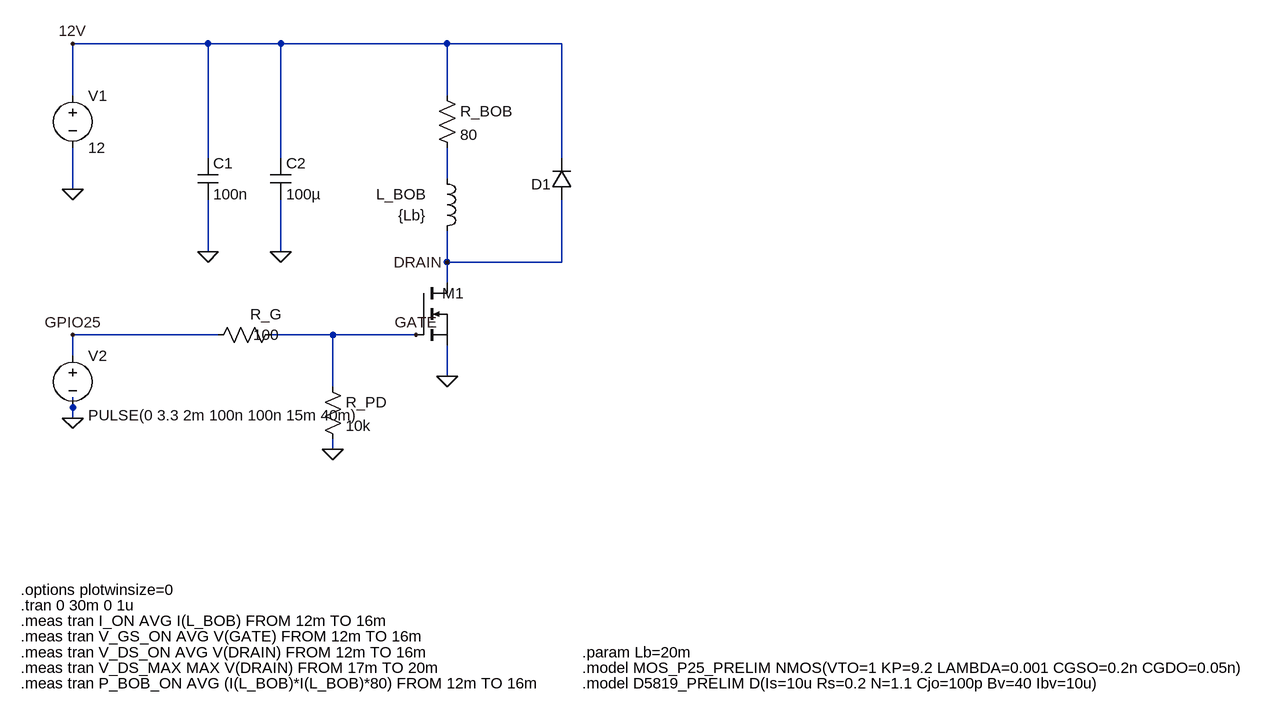
[diagram p0: schematic 01_P25_Pulsos.asc]
01_P25_Pulsos.asc, the LTspice schematic file:
Version 4.1
SHEET 1 1976 1200
WIRE 336 112 128 112
WIRE 448 112 336 112
WIRE 704 112 448 112
WIRE 880 112 704 112
WIRE 128 192 128 112
WIRE 704 192 704 112
WIRE 336 288 336 112
WIRE 448 288 448 112
WIRE 880 288 880 112
WIRE 704 320 704 272
WIRE 128 336 128 272
WIRE 336 432 336 352
WIRE 448 432 448 352
WIRE 704 448 704 400
WIRE 880 448 880 352
WIRE 880 448 704 448
WIRE 704 480 704 448
WIRE 352 560 128 560
WIRE 528 560 432 560
WIRE 656 560 528 560
WIRE 128 592 128 560
WIRE 704 624 704 576
WIRE 528 640 528 560
WIRE 128 672 128 656
WIRE 128 688 128 672
WIRE 528 736 528 720
FLAG 128 112 12V
FLAG 704 448 DRAIN
FLAG 656 560 GATE
FLAG 128 560 GPIO25
FLAG 128 336 0
FLAG 128 688 0
FLAG 336 432 0
FLAG 448 432 0
FLAG 528 736 0
FLAG 704 624 0
SYMBOL voltage 128 176 R0
SYMATTR InstName V1
SYMATTR Value 12
SYMBOL cap 320 288 R0
SYMATTR InstName C1
SYMATTR Value 100n
SYMBOL cap 432 288 R0
SYMATTR InstName C2
SYMATTR Value 100µ
SYMBOL res 688 176 R0
SYMATTR InstName R_BOB
SYMATTR Value 80
SYMBOL ind 688 304 R0
WINDOW 0 -16 40 Right 2
WINDOW 3 -16 72 Right 2
SYMATTR InstName L_BOB
SYMATTR Value {Lb}
SYMBOL nmos 656 480 R0
WINDOW 0 74 16 Right 2
WINDOW 3 74 48 Right 2
SYMATTR InstName M1
SYMATTR Value ""
SYMBOL res 448 544 R90
WINDOW 0 0 22 VBottom 2
WINDOW 3 0 22 VTop 2
SYMATTR InstName R_G
SYMATTR Value 100
SYMBOL res 512 624 R0
SYMATTR InstName R_PD
SYMATTR Value 10k
SYMBOL diode 896 352 R180
WINDOW 0 32 24 Left 2
WINDOW 3 32 -8 Left 2
SYMATTR InstName D1
SYMATTR Value ""
SYMBOL voltage 128 576 R0
WINDOW 3 24 108 Left 2
SYMATTR Value PULSE(0 3.3 2m 100n 100n 15m 40m)
SYMATTR InstName V2
TEXT 912 1048 Left 2 !.param Lb=20m
TEXT 912 1072 Left 2 !.model MOS_P25_PRELIM NMOS(VTO=1 KP=9.2 LAMBDA=0.001 CGSO=0.2n CGDO=0.05n)
TEXT 912 1096 Left 2 !.model D5819_PRELIM D(Is=10u Rs=0.2 N=1.1 Cjo=100p Bv=40 Ibv=10u)
TEXT 48 952 Left 2 !.options plotwinsize=0
TEXT 48 976 Left 2 !.tran 0 30m 0 1u
TEXT 48 1000 Left 2 !.meas tran I_ON AVG I(L_BOB) FROM 12m TO 16m
TEXT 48 1024 Left 2 !.meas tran V_GS_ON AVG V(GATE) FROM 12m TO 16m
TEXT 48 1048 Left 2 !.meas tran V_DS_ON AVG V(DRAIN) FROM 12m TO 16m
TEXT 48 1072 Left 2 !.meas tran V_DS_MAX MAX V(DRAIN) FROM 17m TO 20m
TEXT 48 1096 Left 2 !.meas tran P_BOB_ON AVG (I(L_BOB)*I(L_BOB)*80) FROM 12m TO 16m

The netlist it stands for:
* 01_P25_Pulsos.asc
V1 12V 0 12
C1 12V 0 100n
C2 12V 0 100µ
R_BOB 12V N001 80
L_BOB N001 DRAIN {Lb}
M1 DRAIN GATE 0 0
R_G GATE GPIO25 100
R_PD GATE 0 10k
D1 DRAIN 12V
V2 GPIO25 0 PULSE(0 3.3 2m 100n 100n 15m 40m)
.model D D
.lib standard.dio
.model NMOS NMOS
.model PMOS PMOS
.lib standard.mos
.param Lb=20m
.model MOS_P25_PRELIM NMOS(VTO=1 KP=9.2 LAMBDA=0.001 CGSO=0.2n CGDO=0.05n)
.model D5819_PRELIM D(Is=10u Rs=0.2 N=1.1 Cjo=100p Bv=40 Ibv=10u)
.options plotwinsize=0
.tran 0 30m 0 1u
.meas tran I_ON AVG I(L_BOB) FROM 12m TO 16m
.meas tran V_GS_ON AVG V(GATE) FROM 12m TO 16m
.meas tran V_DS_ON AVG V(DRAIN) FROM 12m TO 16m
.meas tran V_DS_MAX MAX V(DRAIN) FROM 17m TO 20m
.meas tran P_BOB_ON AVG (I(L_BOB)*I(L_BOB)*80) FROM 12m TO 16m
.backanno
.end